# Altium schematic sheet Top-Sheet.SchDoc
size A4; SheetNumber: 1; SheetTotal: 10
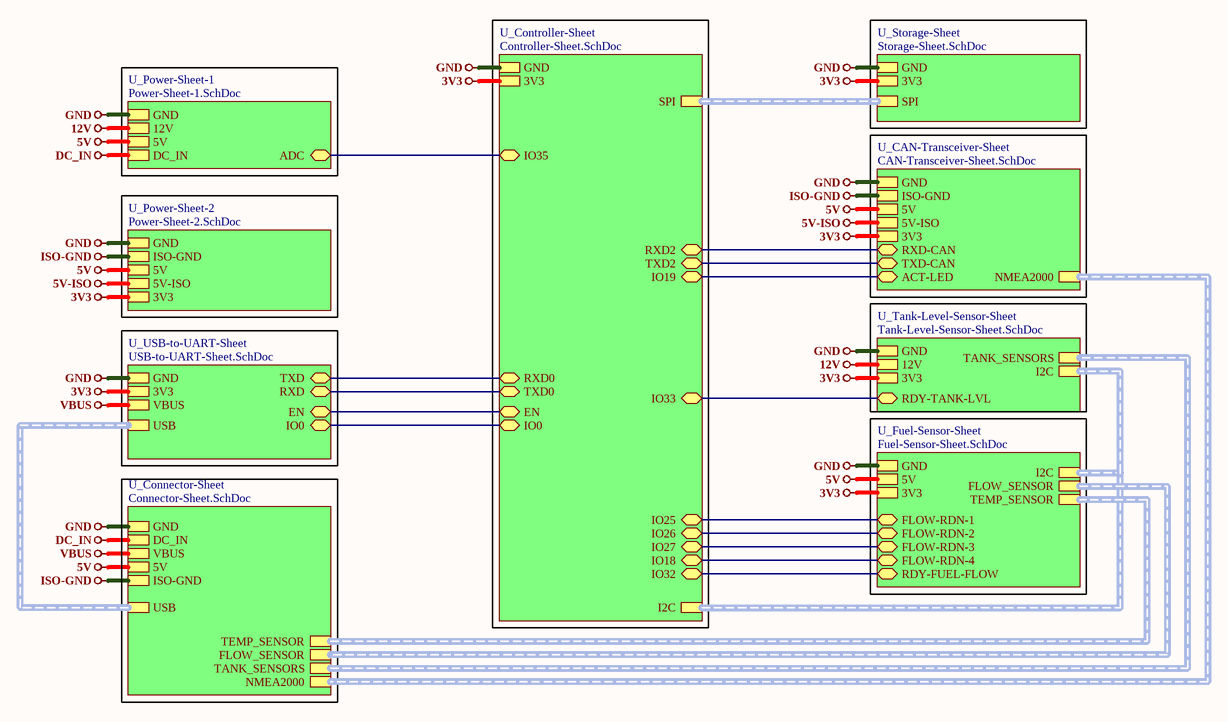
[diagram p0: Top-Sheet.SchDoc]

## Sub-sheets
U_CAN-Transceiver-Sheet = CAN-Transceiver-Sheet.SchDoc: GND, 3V3, 5V-ISO, ISO-GND, RXD-CAN (bidir), TXD-CAN (bidir), ACT-LED (bidir), 5V, NMEA2000 (harness NMEA2000)
U_Connector-Sheet = Connector-Sheet.SchDoc: GND, DC_IN, VBUS, USB (harness USB), NMEA2000 (harness NMEA2000), ISO-GND, TANK_SENSORS (harness TANK_SENSORS), TEMP_SENSOR (harness TEMP_SENSOR), FLOW_SENSOR (harness FLOW_SENSOR), 5V
U_Controller-Sheet = Controller-Sheet.SchDoc: I2C (harness I2C), GND, 3V3, SPI (harness SPI), TXD0 (bidir), RXD0 (bidir), EN (bidir), IO0 (bidir), TXD2 (bidir), RXD2 (bidir), IO25 (bidir), IO26 (bidir), IO27 (bidir), IO18 (bidir), IO19 (bidir), IO35 (bidir), IO32 (bidir), IO33 (bidir)
U_Fuel-Sensor-Sheet = Fuel-Sensor-Sheet.SchDoc: I2C (harness I2C), 5V, GND, 3V3, FLOW-RDN-1 (bidir), FLOW-RDN-2 (bidir), FLOW-RDN-3 (bidir), FLOW-RDN-4 (bidir), RDY-FUEL-FLOW (bidir), TEMP_SENSOR (harness TEMP_SENSOR), FLOW_SENSOR (harness FLOW_SENSOR)
U_Power-Sheet-1 = Power-Sheet-1.SchDoc: 5V, GND, 12V, ADC (bidir), DC_IN
U_Power-Sheet-2 = Power-Sheet-2.SchDoc: 5V, GND, 3V3, 5V-ISO, ISO-GND
U_Storage-Sheet = Storage-Sheet.SchDoc: SPI (harness SPI), GND, 3V3
U_Tank-Level-Sensor-Sheet = Tank-Level-Sensor-Sheet.SchDoc: GND, 3V3, 12V, I2C (harness I2C), RDY-TANK-LVL (bidir), TANK_SENSORS (harness TANK_SENSORS)
U_USB-to-UART-Sheet = USB-to-UART-Sheet.SchDoc: GND, 3V3, TXD (bidir), RXD (bidir), EN (bidir), IO0 (bidir), VBUS, USB (harness USB)

## Nets
3V3: sheet U_Power-Sheet-2/3V3, sheet U_USB-to-UART-Sheet/3V3, sheet U_Controller-Sheet/3V3, sheet U_Storage-Sheet/3V3, sheet U_CAN-Transceiver-Sheet/3V3, sheet U_Tank-Level-Sensor-Sheet/3V3, sheet U_Fuel-Sensor-Sheet/3V3
5V: sheet U_Power-Sheet-1/5V, sheet U_Power-Sheet-2/5V, sheet U_CAN-Transceiver-Sheet/5V, sheet U_Fuel-Sensor-Sheet/5V, sheet U_Connector-Sheet/5V
5V-ISO: sheet U_Power-Sheet-2/5V-ISO, sheet U_CAN-Transceiver-Sheet/5V-ISO
12V: sheet U_Power-Sheet-1/12V, sheet U_Tank-Level-Sensor-Sheet/12V
DC_IN: sheet U_Power-Sheet-1/DC_IN, sheet U_Connector-Sheet/DC_IN
GND: sheet U_Power-Sheet-1/GND, sheet U_Power-Sheet-2/GND, sheet U_USB-to-UART-Sheet/GND, sheet U_Controller-Sheet/GND, sheet U_Storage-Sheet/GND, sheet U_CAN-Transceiver-Sheet/GND, sheet U_Tank-Level-Sensor-Sheet/GND, sheet U_Fuel-Sensor-Sheet/GND, sheet U_Connector-Sheet/GND
ISO-GND: sheet U_Power-Sheet-2/ISO-GND, sheet U_CAN-Transceiver-Sheet/ISO-GND, sheet U_Connector-Sheet/ISO-GND
VBUS: sheet U_USB-to-UART-Sheet/VBUS, sheet U_Connector-Sheet/VBUS
(unnamed): sheet U_Power-Sheet-1/ADC, sheet U_Controller-Sheet/IO35
(unnamed): sheet U_USB-to-UART-Sheet/TXD, sheet U_Controller-Sheet/RXD0
(unnamed): sheet U_USB-to-UART-Sheet/RXD, sheet U_Controller-Sheet/TXD0
(unnamed): sheet U_USB-to-UART-Sheet/EN, sheet U_Controller-Sheet/EN
(unnamed): sheet U_USB-to-UART-Sheet/IO0, sheet U_Controller-Sheet/IO0
(unnamed): sheet U_Controller-Sheet/TXD2, sheet U_CAN-Transceiver-Sheet/TXD-CAN
(unnamed): sheet U_Controller-Sheet/RXD2, sheet U_CAN-Transceiver-Sheet/RXD-CAN
(unnamed): sheet U_Controller-Sheet/IO25, sheet U_Fuel-Sensor-Sheet/FLOW-RDN-1
(unnamed): sheet U_Controller-Sheet/IO26, sheet U_Fuel-Sensor-Sheet/FLOW-RDN-2
(unnamed): sheet U_Controller-Sheet/IO27, sheet U_Fuel-Sensor-Sheet/FLOW-RDN-3
(unnamed): sheet U_Controller-Sheet/IO18, sheet U_Fuel-Sensor-Sheet/FLOW-RDN-4
(unnamed): sheet U_Controller-Sheet/IO19, sheet U_CAN-Transceiver-Sheet/ACT-LED
(unnamed): sheet U_Controller-Sheet/IO32, sheet U_Fuel-Sensor-Sheet/RDY-FUEL-FLOW
(unnamed): sheet U_Controller-Sheet/IO33, sheet U_Tank-Level-Sensor-Sheet/RDY-TANK-LVL

## Buses and harness runs
harness sheet U_CAN-Transceiver-Sheet/NMEA2000 = sheet U_Connector-Sheet/NMEA2000
harness sheet U_Connector-Sheet/FLOW_SENSOR = sheet U_Fuel-Sensor-Sheet/FLOW_SENSOR
harness sheet U_Connector-Sheet/TANK_SENSORS = sheet U_Tank-Level-Sensor-Sheet/TANK_SENSORS
harness sheet U_Connector-Sheet/TEMP_SENSOR = sheet U_Fuel-Sensor-Sheet/TEMP_SENSOR
harness sheet U_Connector-Sheet/USB = sheet U_USB-to-UART-Sheet/USB
harness sheet U_Controller-Sheet/I2C = sheet U_Fuel-Sensor-Sheet/I2C = sheet U_Tank-Level-Sensor-Sheet/I2C
harness sheet U_Controller-Sheet/SPI = sheet U_Storage-Sheet/SPI

## Notes on the sheet
- File:
- Title:
- Date:
- Page
- Num:
- Total:
- Drawn By: Huzaifa Ali